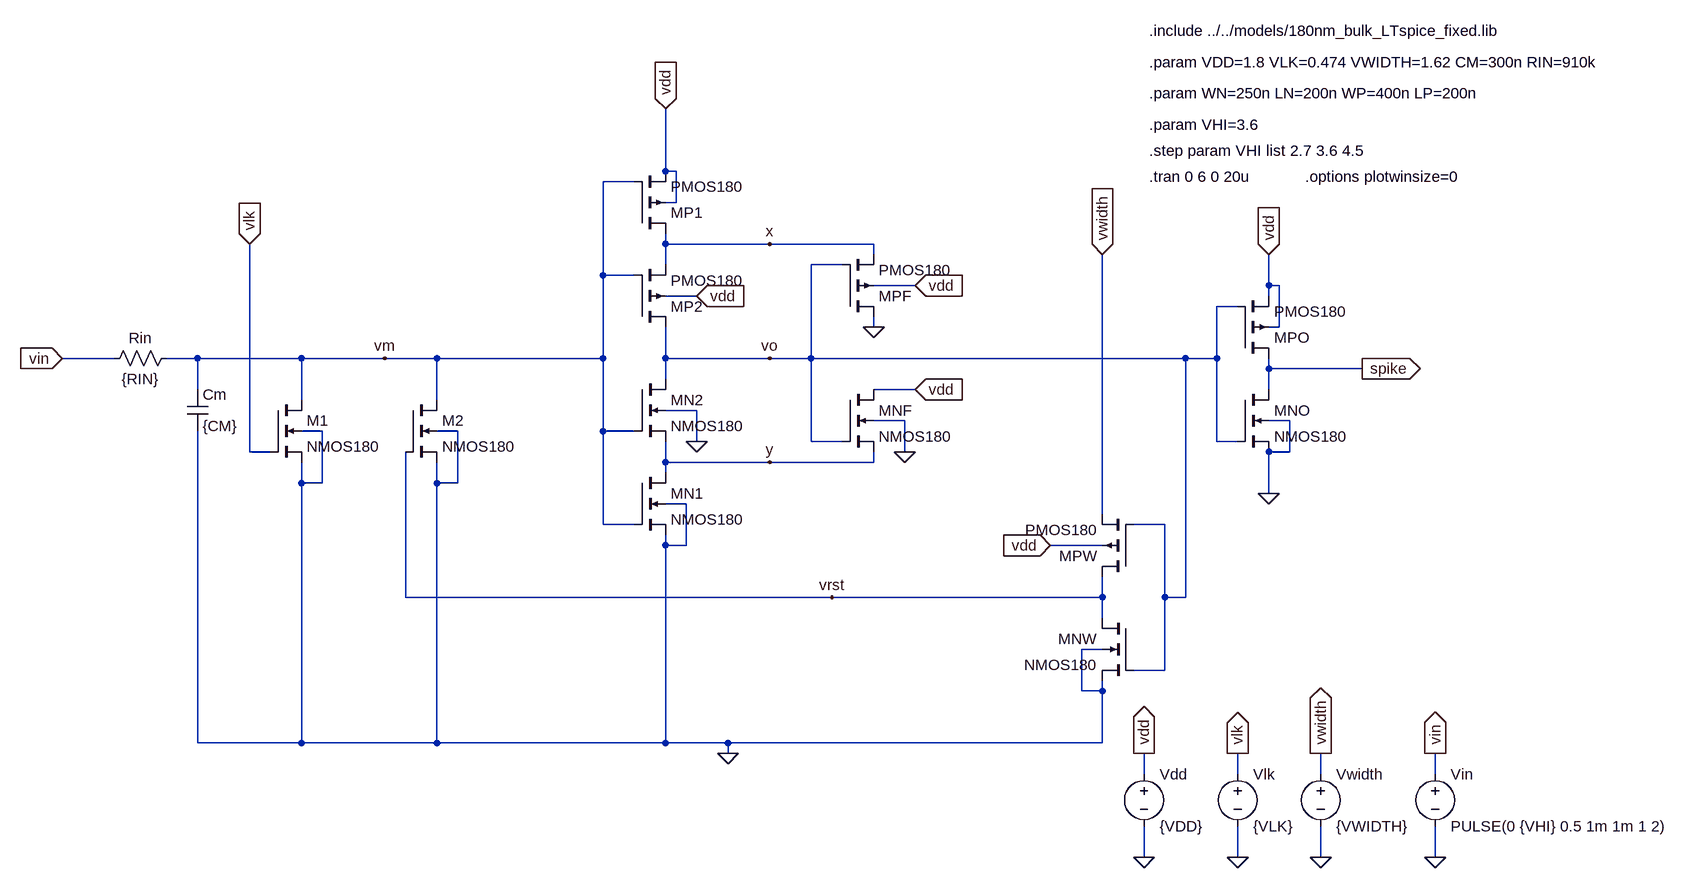
[diagram p0: schematic LIF_R2_fig10.asc]
LIF_R2_fig10.asc, the LTspice schematic file:
Version 4
SHEET 1 1940 1204
WIRE 208 128 208 32
WIRE 224 128 208 128
WIRE 160 144 112 144
WIRE 224 176 224 128
WIRE 224 176 208 176
WIRE 208 240 208 224
WIRE 368 240 208 240
WIRE 528 240 368 240
WIRE 528 256 528 240
WIRE 208 272 208 240
WIRE 480 272 432 272
WIRE 112 288 112 144
WIRE 160 288 112 288
WIRE 592 304 528 304
WIRE 1136 304 1136 256
WIRE 1152 304 1136 304
WIRE 256 320 208 320
WIRE 1136 320 1136 304
WIRE 1088 336 1056 336
WIRE 528 368 528 352
WIRE 1152 368 1152 304
WIRE 1152 368 1136 368
WIRE -640 416 -720 416
WIRE -512 416 -560 416
WIRE -352 416 -512 416
WIRE -224 416 -352 416
WIRE -144 416 -224 416
WIRE 112 416 112 288
WIRE 112 416 -144 416
WIRE 208 416 208 368
WIRE 368 416 208 416
WIRE 432 416 432 272
WIRE 432 416 368 416
WIRE 1008 416 432 416
WIRE 1056 416 1056 336
WIRE 1056 416 1008 416
WIRE 1136 432 1136 416
WIRE 1280 432 1136 432
WIRE 208 448 208 416
WIRE -512 464 -512 416
WIRE 592 464 528 464
WIRE 1136 464 1136 432
WIRE -352 480 -352 416
WIRE -144 480 -144 416
WIRE 256 496 208 496
WIRE 576 512 528 512
WIRE 1168 512 1136 512
WIRE -320 528 -352 528
WIRE -112 528 -144 528
WIRE 112 528 112 416
WIRE 160 528 112 528
WIRE 256 544 256 496
WIRE 432 544 432 416
WIRE 480 544 432 544
WIRE 1056 544 1056 416
WIRE 1088 544 1056 544
WIRE -432 560 -432 240
WIRE -400 560 -432 560
WIRE 576 560 576 512
WIRE 1168 560 1168 512
WIRE 1168 560 1136 560
WIRE 208 576 208 544
WIRE 368 576 208 576
WIRE 528 576 528 560
WIRE 528 576 368 576
WIRE 208 592 208 576
WIRE -352 608 -352 576
WIRE -320 608 -320 528
WIRE -320 608 -352 608
WIRE -144 608 -144 576
WIRE -112 608 -112 528
WIRE -112 608 -144 608
WIRE 1136 624 1136 560
WIRE 240 640 208 640
WIRE 880 656 880 256
WIRE 112 672 112 528
WIRE 160 672 112 672
WIRE 976 672 928 672
WIRE 208 704 208 688
WIRE 240 704 240 640
WIRE 240 704 208 704
WIRE 880 704 800 704
WIRE -192 784 -192 560
WIRE 464 784 -192 784
WIRE 880 784 880 752
WIRE 880 784 464 784
WIRE 976 784 976 672
WIRE 1008 784 1008 416
WIRE 1008 784 976 784
WIRE 880 816 880 784
WIRE 880 864 848 864
WIRE 976 896 976 784
WIRE 976 896 928 896
WIRE 848 928 848 864
WIRE 880 928 880 912
WIRE 880 928 848 928
WIRE -512 1008 -512 528
WIRE -352 1008 -352 608
WIRE -352 1008 -512 1008
WIRE -144 1008 -144 608
WIRE -144 1008 -352 1008
WIRE 208 1008 208 704
WIRE 208 1008 -144 1008
WIRE 304 1008 208 1008
WIRE 880 1008 880 928
WIRE 880 1008 304 1008
WIRE 304 1024 304 1008
WIRE 944 1056 944 1024
WIRE 1088 1056 1088 1024
WIRE 1216 1056 1216 1024
WIRE 1392 1056 1392 1024
WIRE 944 1184 944 1136
WIRE 1088 1184 1088 1136
WIRE 1216 1184 1216 1136
WIRE 1392 1184 1392 1136
FLAG 208 32 vdd
IOPIN 208 32 In
FLAG 304 1024 0
FLAG -432 240 vlk
IOPIN -432 240 In
FLAG -224 416 vm
FLAG -720 416 vin
IOPIN -720 416 In
FLAG 368 416 vo
FLAG 592 464 vdd
IOPIN 592 464 In
FLAG 368 576 y
FLAG 528 368 0
FLAG 1136 624 0
FLAG 1136 256 vdd
IOPIN 1136 256 In
FLAG 1280 432 spike
IOPIN 1280 432 Out
FLAG 368 240 x
FLAG 464 784 vrst
FLAG 880 256 vwidth
IOPIN 880 256 In
FLAG 256 544 0
FLAG 576 560 0
FLAG 256 320 vdd
IOPIN 256 320 In
FLAG 592 304 vdd
IOPIN 592 304 In
FLAG 800 704 vdd
IOPIN 800 704 In
FLAG 944 1184 0
FLAG 1392 1184 0
FLAG 1088 1184 0
FLAG 1216 1184 0
FLAG 944 1024 vdd
IOPIN 944 1024 Out
FLAG 1392 1024 vin
IOPIN 1392 1024 Out
FLAG 1088 1024 vlk
IOPIN 1088 1024 Out
FLAG 1216 1024 vwidth
IOPIN 1216 1024 Out
SYMBOL nmos4 -400 480 R0
SYMATTR InstName M1
SYMATTR Value NMOS180
SYMATTR Value2 l={LN} w={WN}
SYMBOL nmos4 -192 480 R0
SYMATTR InstName M2
SYMATTR Value NMOS180
SYMATTR Value2 l={LN} w={WN}
SYMBOL pmos4 160 224 M180
SYMATTR InstName MP1
SYMATTR Value PMOS180
SYMATTR Value2 l={LP} w={WP}
SYMBOL pmos4 160 368 M180
SYMATTR InstName MP2
SYMATTR Value PMOS180
SYMATTR Value2 l={LP} w={WP}
SYMBOL nmos4 160 592 R0
SYMATTR InstName MN1
SYMATTR Value NMOS180
SYMATTR Value2 l={LN} w={WN}
SYMBOL nmos4 160 448 R0
SYMATTR InstName MN2
SYMATTR Value NMOS180
SYMATTR Value2 l={LN} w={WN}
SYMBOL pmos4 480 352 M180
SYMATTR InstName MPF
SYMATTR Value PMOS180
SYMATTR Value2 l={LP} w={WP}
SYMBOL nmos4 480 464 R0
SYMATTR InstName MNF
SYMATTR Value NMOS180
SYMATTR Value2 l={LN} w={WN}
SYMBOL pmos4 928 752 R180
SYMATTR InstName MPW
SYMATTR Value PMOS180
SYMATTR Value2 l={LP} w={WP}
SYMBOL pmos4 1088 416 M180
SYMATTR InstName MPO
SYMATTR Value PMOS180
SYMATTR Value2 l={LP} w={WP}
SYMBOL nmos4 928 816 M0
SYMATTR InstName MNW
SYMATTR Value NMOS180
SYMATTR Value2 l={LN} w={WN}
SYMBOL nmos4 1088 464 R0
SYMATTR InstName MNO
SYMATTR Value NMOS180
SYMATTR Value2 l={LN} w={WN}
SYMBOL res -544 400 R90
WINDOW 0 0 56 VBottom 2
WINDOW 3 32 56 VTop 2
SYMATTR InstName Rin
SYMATTR Value {RIN}
SYMBOL cap -528 464 R0
SYMATTR InstName Cm
SYMATTR Value {CM}
SYMBOL voltage 944 1040 R0
WINDOW 123 0 0 Left 0
WINDOW 39 0 0 Left 0
SYMATTR InstName Vdd
SYMATTR Value {VDD}
SYMBOL voltage 1392 1040 R0
WINDOW 123 0 0 Left 0
WINDOW 39 0 0 Left 0
SYMATTR InstName Vin
SYMATTR Value PULSE(0 {VHI} 0.5 1m 1m 1 2)
SYMBOL voltage 1088 1040 R0
WINDOW 123 0 0 Left 0
WINDOW 39 0 0 Left 0
SYMATTR InstName Vlk
SYMATTR Value {VLK}
SYMBOL voltage 1216 1040 R0
WINDOW 123 0 0 Left 0
WINDOW 39 0 0 Left 0
SYMATTR InstName Vwidth
SYMATTR Value {VWIDTH}
TEXT 952 -88 Left 2 !.include ../../models/180nm_bulk_LTspice_fixed.lib
TEXT 952 -40 Left 2 !.param VDD=1.8 VLK=0.474 VWIDTH=1.62 CM=300n RIN=910k
TEXT 952 8 Left 2 !.param WN=250n LN=200n WP=400n LP=200n
TEXT 952 56 Left 2 !.param VHI=3.6
TEXT 952 96 Left 2 !.step param VHI list 2.7 3.6 4.5
TEXT 952 136 Left 2 !.tran 0 6 0 20u
TEXT 1192 136 Left 2 !.options plotwinsize=0

The netlist it stands for:
* LIF_R2_fig10.asc
M1 vm vlk 0 0 NMOS180 l={LN} w={WN}
M2 vm vrst 0 0 NMOS180 l={LN} w={WN}
MP1 x vm vdd vdd PMOS180 l={LP} w={WP}
MP2 vo vm x vdd PMOS180 l={LP} w={WP}
MN1 y vm 0 0 NMOS180 l={LN} w={WN}
MN2 vo vm y 0 NMOS180 l={LN} w={WN}
MPF 0 vo x vdd PMOS180 l={LP} w={WP}
MNF vdd vo y 0 NMOS180 l={LN} w={WN}
MPW vrst vo vwidth vdd PMOS180 l={LP} w={WP}
MPO spike vo vdd vdd PMOS180 l={LP} w={WP}
MNW vrst vo 0 0 NMOS180 l={LN} w={WN}
MNO spike vo 0 0 NMOS180 l={LN} w={WN}
Rin vm vin {RIN}
Cm vm 0 {CM}
Vdd vdd 0 {VDD}
Vin vin 0 PULSE(0 {VHI} 0.5 1m 1m 1 2)
Vlk vlk 0 {VLK}
Vwidth vwidth 0 {VWIDTH}
.model NMOS NMOS
.model PMOS PMOS
.lib standard.mos
.include ../../models/180nm_bulk_LTspice_fixed.lib
.param VDD=1.8 VLK=0.474 VWIDTH=1.62 CM=300n RIN=910k
.param WN=250n LN=200n WP=400n LP=200n
.param VHI=3.6
.step param VHI list 2.7 3.6 4.5
.tran 0 6 0 20u
.options plotwinsize=0
.backanno
.end